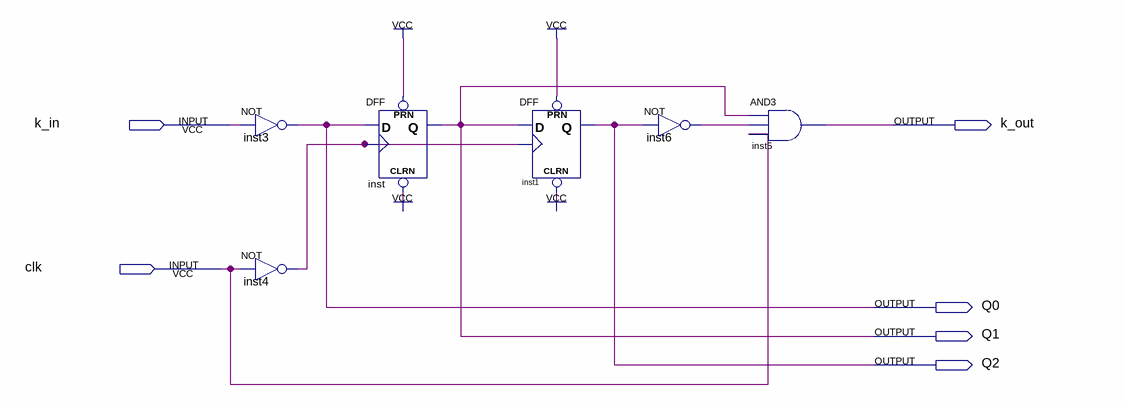
[diagram p0: schematic sheet]
// Quartus schematic keyin.bdf as structural Verilog: 6 symbols, 6 pins
module keyin (
  input  k_in,
  input  clk,
  output k_out,
  output Q0,
  output Q1,
  output Q2
);

  wire inst4_out, inst6_out;

  not inst3 (Q0, k_in);
  not inst4 (inst4_out, clk);
  DFF inst (.CLRN(1'b1), .CLK(inst4_out), .D(Q0), .PRN(1'b1), .Q(Q1));
  DFF inst1 (.CLRN(1'b1), .CLK(inst4_out), .D(Q1), .PRN(1'b1), .Q(Q2));
  not inst6 (inst6_out, Q2);
  and inst5 (k_out, Q1, inst6_out, clk);
endmodule
